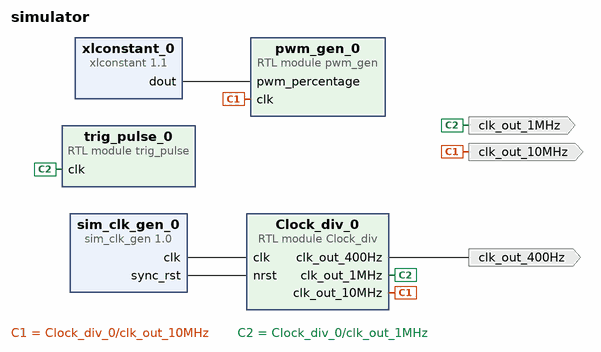
[diagram p0: block diagram of the top level]
# Vivado block design simulator, xc7z020clg400-1, Vivado 2023.1
create_bd_design simulator

create_bd_port -dir O clk_out_400Hz
create_bd_port -dir O clk_out_1MHz
create_bd_port -dir O clk_out_10MHz

create_bd_cell -type ip -vlnv xilinx.com:ip:sim_clk_gen:1.0 sim_clk_gen_0
set_property -dict {CONFIG.FREQ_HZ 100000000 CONFIG.RESET_POLARITY ACTIVE_HIGH} [get_bd_cells sim_clk_gen_0]
create_bd_cell -type ip -vlnv xilinx.com:ip:xlconstant:1.1 xlconstant_0
set_property -dict {CONFIG.CONST_VAL 99 CONFIG.CONST_WIDTH 8} [get_bd_cells xlconstant_0]
create_bd_cell -type module -reference trig_pulse trig_pulse_0
create_bd_cell -type module -reference Clock_div Clock_div_0
create_bd_cell -type module -reference pwm_gen pwm_gen_0

# ---- connections ----

connect_bd_net [get_bd_pins Clock_div_0/clk_out_10MHz] [get_bd_ports clk_out_10MHz] [get_bd_pins pwm_gen_0/clk]
connect_bd_net [get_bd_pins Clock_div_0/clk_out_1MHz] [get_bd_ports clk_out_1MHz] [get_bd_pins trig_pulse_0/clk]
connect_bd_net [get_bd_pins Clock_div_0/clk_out_400Hz] [get_bd_ports clk_out_400Hz]
connect_bd_net [get_bd_pins sim_clk_gen_0/clk] [get_bd_pins Clock_div_0/clk]
connect_bd_net [get_bd_pins sim_clk_gen_0/sync_rst] [get_bd_pins Clock_div_0/nrst]
connect_bd_net [get_bd_pins xlconstant_0/dout] [get_bd_pins pwm_gen_0/pwm_percentage]

validate_bd_design
save_bd_design
